# Altium schematic sheet DC_Sense_Section.SchDoc
size A4; DocumentNumber: 3; SheetNumber: 3; SheetTotal: 6
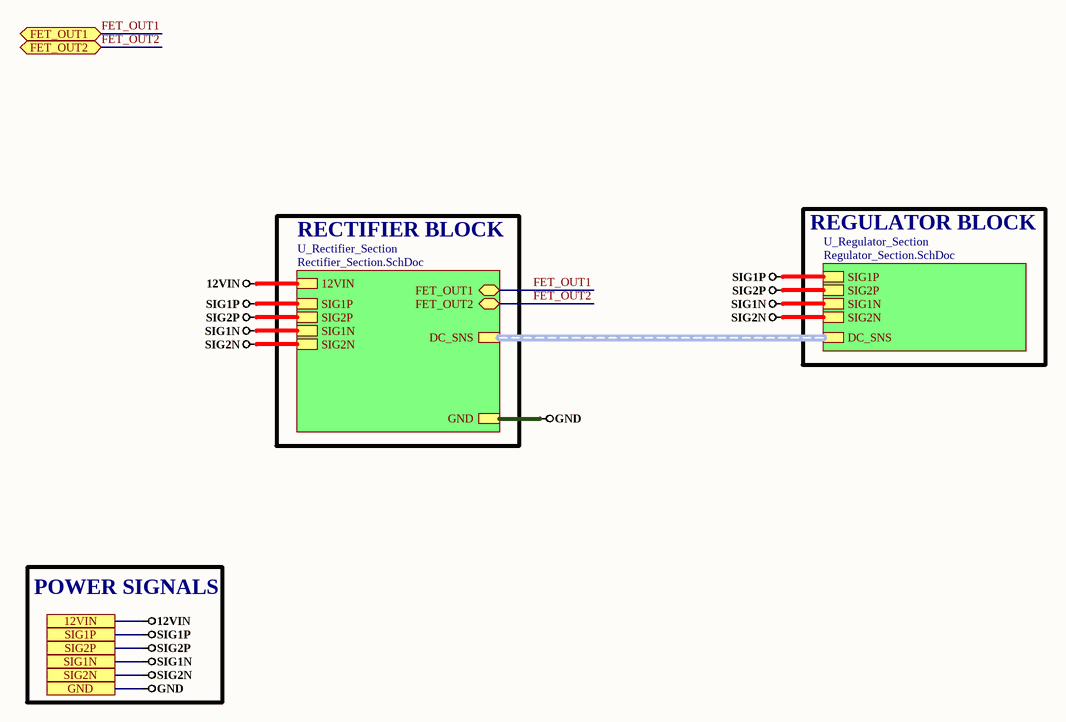
[diagram p0: DC_Sense_Section.SchDoc]

## Sub-sheets
U_Rectifier_Section = Rectifier_Section.SchDoc: 12VIN, DC_SNS (harness DC_SNS), FET_OUT1 (bidir), FET_OUT2 (bidir), GND, SIG1P, SIG2P, SIG1N, SIG2N
U_Regulator_Section = Regulator_Section.SchDoc: DC_SNS (harness DC_SNS), SIG1P, SIG2P, SIG1N, SIG2N

## Ports
12VIN, FET_OUT1 (bidir), FET_OUT2 (bidir), GND, SIG1N, SIG1P, SIG2N, SIG2P

## Nets
12VIN: port 12VIN, sheet U_Rectifier_Section/12VIN
GND: port GND, sheet U_Rectifier_Section/GND
SIG1N: port SIG1N, sheet U_Rectifier_Section/SIG1N, sheet U_Regulator_Section/SIG1N
SIG1P: port SIG1P, sheet U_Rectifier_Section/SIG1P, sheet U_Regulator_Section/SIG1P
SIG2N: port SIG2N, sheet U_Rectifier_Section/SIG2N, sheet U_Regulator_Section/SIG2N
SIG2P: port SIG2P, sheet U_Rectifier_Section/SIG2P, sheet U_Regulator_Section/SIG2P
FET_OUT1: port FET_OUT1, sheet U_Rectifier_Section/FET_OUT1
FET_OUT2: port FET_OUT2, sheet U_Rectifier_Section/FET_OUT2

## Buses and harness runs
harness sheet U_Rectifier_Section/DC_SNS = sheet U_Regulator_Section/DC_SNS

## Notes on the sheet
- RECTIFIER BLOCK
- REGULATOR BLOCK
- POWER SIGNALS